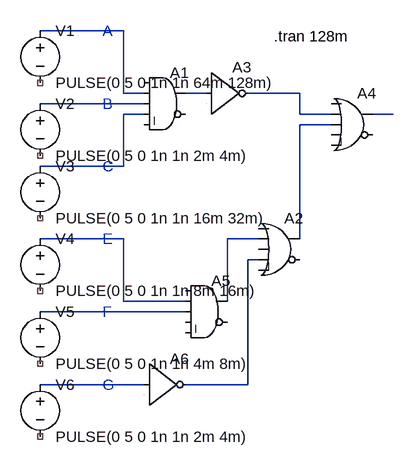
[diagram p0: schematic 11d.asc]
11d.asc, the LTspice schematic file:
Version 4.1
SHEET 1 880 704
WIRE 48 64 -80 64
WIRE 48 160 48 64
WIRE 80 160 48 160
WIRE 176 160 144 160
WIRE 320 160 240 160
WIRE 80 176 -80 176
WIRE 80 192 48 192
WIRE 320 192 320 160
WIRE 368 192 320 192
WIRE 464 192 432 192
WIRE 368 208 320 208
WIRE 48 272 48 192
WIRE 48 272 -80 272
WIRE 48 384 -80 384
WIRE 256 384 208 384
WIRE 320 384 320 208
WIRE 256 416 240 416
WIRE 48 480 48 384
WIRE 144 480 48 480
WIRE 208 480 208 384
WIRE 144 496 -80 496
WIRE 80 608 -80 608
WIRE 240 608 240 416
WIRE 240 608 144 608
SYMBOL Digital\\and 112 112 R0
SYMATTR InstName A1
SYMBOL voltage -80 48 R0
WINDOW 123 0 0 Left 0
WINDOW 39 0 0 Left 0
SYMATTR InstName V1
SYMATTR Value PULSE(0 5 0 1n 1n 64m 128m)
SYMBOL voltage -80 160 R0
WINDOW 123 0 0 Left 0
WINDOW 39 0 0 Left 0
SYMATTR InstName V2
SYMATTR Value PULSE(0 5 0 1n 1n 2m 4m)
SYMBOL voltage -80 256 R0
WINDOW 123 0 0 Left 0
WINDOW 39 0 0 Left 0
SYMATTR InstName V3
SYMATTR Value PULSE(0 5 0 1n 1n 16m 32m)
SYMBOL Digital\\or 400 144 R0
SYMATTR InstName A4
SYMBOL voltage -80 368 R0
WINDOW 123 0 0 Left 0
WINDOW 39 0 0 Left 0
SYMATTR InstName V4
SYMATTR Value PULSE(0 5 0 1n 1n 8m 16m)
SYMBOL voltage -80 480 R0
WINDOW 123 0 0 Left 0
WINDOW 39 0 0 Left 0
SYMATTR InstName V5
SYMATTR Value PULSE(0 5 0 1n 1n 4m 8m)
SYMBOL voltage -80 592 R0
WINDOW 123 0 0 Left 0
WINDOW 39 0 0 Left 0
SYMATTR InstName V6
SYMATTR Value PULSE(0 5 0 1n 1n 2m 4m)
SYMBOL Digital\\inv 176 96 R0
SYMATTR InstName A3
SYMBOL Digital\\and 176 432 R0
SYMATTR InstName A5
SYMBOL Digital\\inv 80 544 R0
SYMATTR InstName A6
SYMBOL Digital\\or 288 336 R0
SYMATTR InstName A2
TEXT 280 72 Left 2 !.tran 128m
TEXT 16 64 Left 2 ;A
TEXT 16 176 Left 2 ;B
TEXT 16 272 Left 2 ;C
TEXT 16 384 Left 2 ;E
TEXT 16 496 Left 2 ;F
TEXT 16 608 Left 2 ;G

The netlist it stands for:
* 11d.asc
A1 0 N001 N004 N005 0 0 N002 0 AND
V1 N001 NC_01 PULSE(0 5 0 1n 1n 64m 128m)
V2 N004 NC_02 PULSE(0 5 0 1n 1n 2m 4m)
V3 N005 NC_03 PULSE(0 5 0 1n 1n 16m 32m)
A4 0 N003 N007 0 0 0 N006 0 OR
V4 N008 NC_04 PULSE(0 5 0 1n 1n 8m 16m)
V5 N011 NC_05 PULSE(0 5 0 1n 1n 4m 8m)
V6 N012 NC_06 PULSE(0 5 0 1n 1n 2m 4m)
A3 N002 0 0 0 0 N003 0 0 BUF
A5 0 N008 N011 0 0 0 N009 0 AND
A6 N012 0 0 0 0 N010 0 0 BUF
A2 0 N009 0 N010 0 0 N007 0 OR
.tran 128m
* A
* B
* C
* E
* F
* G
.backanno
.end